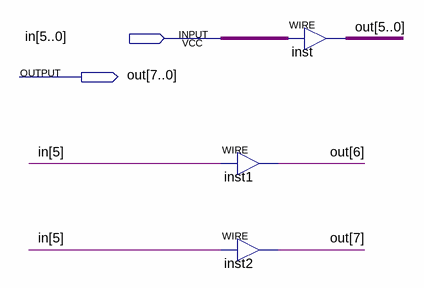
[diagram p0: schematic sheet]
// Quartus schematic signExtend.bdf as structural Verilog: 3 symbols, 2 pins
module signExtend (
  input  [5:0] in,
  output [7:0] out
);

  assign out[6] = in[5];  // WIRE inst1
  assign out[7] = in[5];  // WIRE inst2
  assign out[5:0] = in;  // WIRE inst
endmodule
